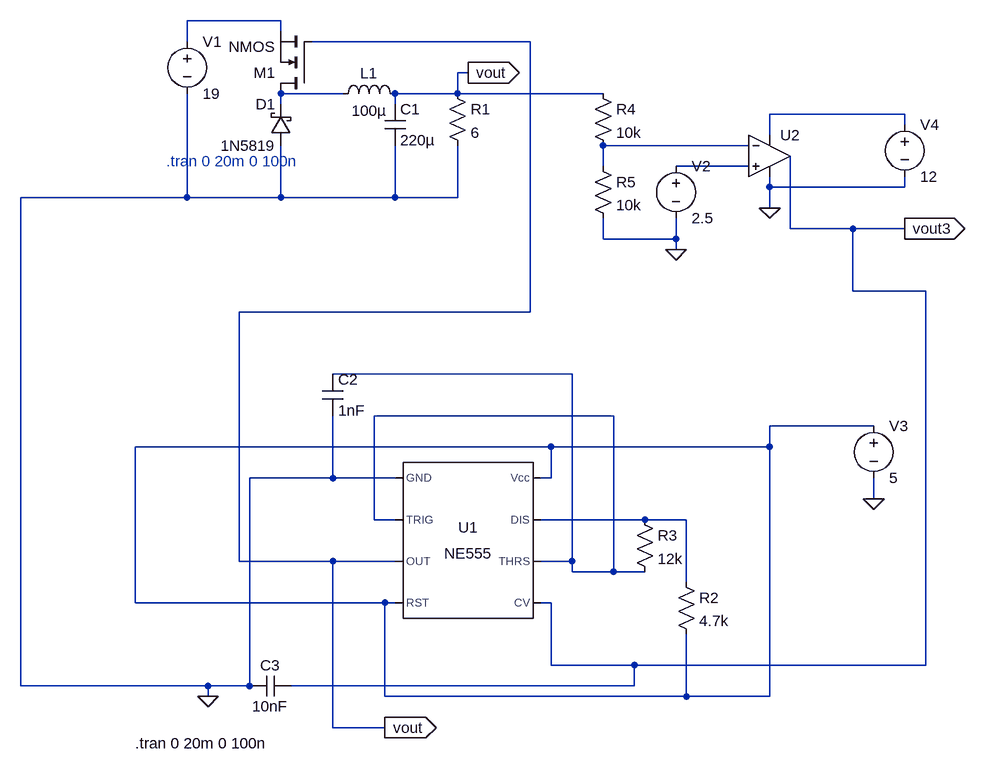
[diagram p0: schematic BUCKCONVERTER.asc]
BUCKCONVERTER.asc, the LTspice schematic file:
Version 4.1
SHEET 1 1076 1224
WIRE -16 64 -160 64
WIRE -16 80 -16 64
WIRE -160 96 -160 64
WIRE 368 96 32 96
WIRE 272 144 256 144
WIRE 80 176 -16 176
WIRE 256 176 256 144
WIRE 256 176 160 176
WIRE 480 176 256 176
WIRE -16 192 -16 176
WIRE 160 192 160 176
WIRE 944 208 736 208
WIRE 944 224 944 208
WIRE 736 240 736 208
WIRE 704 256 480 256
WIRE 480 288 480 256
WIRE 704 288 592 288
WIRE 736 320 736 304
WIRE 944 320 944 304
WIRE 944 320 736 320
WIRE -160 336 -160 176
WIRE -160 336 -416 336
WIRE -16 336 -16 256
WIRE -16 336 -160 336
WIRE 160 336 160 256
WIRE 160 336 -16 336
WIRE 256 336 256 256
WIRE 256 336 160 336
WIRE 736 352 736 320
WIRE 768 384 768 272
WIRE 864 384 768 384
WIRE 944 384 864 384
WIRE 480 400 480 368
WIRE 592 400 592 368
WIRE 592 400 480 400
WIRE 592 416 592 400
WIRE 864 480 864 384
WIRE 976 480 864 480
WIRE 368 512 368 96
WIRE 368 512 -80 512
WIRE 432 608 64 608
WIRE 496 672 128 672
WIRE 896 688 736 688
WIRE 400 720 -240 720
WIRE 736 720 736 688
WIRE 736 720 400 720
WIRE 64 768 64 672
WIRE 64 768 -64 768
WIRE 160 768 64 768
WIRE 400 768 400 720
WIRE 400 768 384 768
WIRE 896 800 896 768
WIRE 128 832 128 672
WIRE 160 832 128 832
WIRE 544 832 384 832
WIRE 608 832 544 832
WIRE -80 896 -80 512
WIRE 64 896 -80 896
WIRE 160 896 64 896
WIRE 432 896 432 608
WIRE 432 896 384 896
WIRE 432 912 432 896
WIRE 496 912 496 672
WIRE 496 912 432 912
WIRE 544 912 496 912
WIRE 608 928 608 832
WIRE -240 960 -240 720
WIRE 144 960 -240 960
WIRE 160 960 144 960
WIRE 400 960 384 960
WIRE 400 1056 400 960
WIRE 528 1056 400 1056
WIRE 976 1056 976 480
WIRE 976 1056 528 1056
WIRE -416 1088 -416 336
WIRE -128 1088 -416 1088
WIRE -64 1088 -64 768
WIRE -64 1088 -128 1088
WIRE 528 1088 528 1056
WIRE 528 1088 0 1088
WIRE -128 1104 -128 1088
WIRE 144 1104 144 960
WIRE 608 1104 608 1008
WIRE 608 1104 144 1104
WIRE 736 1104 736 720
WIRE 736 1104 608 1104
WIRE 64 1152 64 896
WIRE 144 1152 64 1152
FLAG 272 144 vout
IOPIN 272 144 Out
FLAG 144 1152 vout
IOPIN 144 1152 Out
FLAG -128 1104 0
FLAG 896 800 0
FLAG 736 352 0
FLAG 592 416 0
FLAG 944 384 vout3
IOPIN 944 384 Out
SYMBOL voltage -160 80 R0
WINDOW 123 0 0 Left 0
WINDOW 39 0 0 Left 0
SYMATTR InstName V1
SYMATTR Value 19
SYMBOL nmos 32 176 R180
SYMATTR InstName M1
SYMBOL ind 64 192 R270
WINDOW 0 32 56 VTop 2
WINDOW 3 5 56 VBottom 2
SYMATTR InstName L1
SYMATTR Value 100µ
SYMATTR SpiceLine Ipk=0.04 Rser=11 Rpar=2.11267e+06 Cpar=1.754p mfg="Würth Elektronik" pn="74476420 WE-GF 1210"
SYMBOL cap 144 192 R0
SYMATTR Value 220µ
SYMATTR InstName C1
SYMATTR SpiceLine V=2 Irms=3 Rser=0.015 Lser=0 mfg="Panasonic" pn="EEFUD0D221R" type="Al electrolytic"
SYMBOL res 240 160 R0
SYMATTR InstName R1
SYMATTR Value 6
SYMBOL schottky 0 256 R180
WINDOW 0 24 64 Left 2
WINDOW 3 24 0 Left 2
SYMATTR InstName D1
SYMATTR Value 1N5819
SYMBOL Misc\\NE555 272 864 R0
SYMATTR InstName U1
SYMBOL res 592 912 R0
SYMATTR InstName R2
SYMATTR Value 4.7k
SYMBOL res 528 816 R0
SYMATTR InstName R3
SYMATTR Value 12k
SYMBOL cap 48 608 R0
SYMATTR InstName C2
SYMATTR Value 1nF
SYMBOL voltage 896 672 R0
WINDOW 123 0 0 Left 0
WINDOW 39 0 0 Left 0
SYMATTR InstName V3
SYMATTR Value 5
SYMBOL res 464 160 R0
SYMATTR InstName R4
SYMATTR Value 10k
SYMBOL res 464 272 R0
SYMATTR InstName R5
SYMATTR Value 10k
SYMBOL OpAmps\\UniversalOpAmp2 736 272 R0
SYMATTR InstName U2
SYMBOL voltage 592 272 R0
WINDOW 123 0 0 Left 0
WINDOW 39 0 0 Left 0
SYMATTR InstName V2
SYMATTR Value 2.5
SYMBOL voltage 944 208 R0
WINDOW 123 0 0 Left 0
WINDOW 39 0 0 Left 0
SYMATTR InstName V4
SYMATTR Value 12
SYMBOL cap 0 1072 R90
WINDOW 0 0 32 VBottom 2
WINDOW 3 32 32 VTop 2
SYMATTR InstName C3
SYMATTR Value 10nF
TEXT -192 280 Left 2 ;.tran 0 20m 0 100n
TEXT -240 1176 Left 2 !.tran 0 20m 0 100n

The netlist it stands for:
* BUCKCONVERTER.asc
V1 N001 0 19
M1 N002 vout N001 N001 NMOS
L1 N002 vout 100µ Ipk=0.04 Rser=11 Rpar=2.11267e+06 Cpar=1.754p mfg="Würth Elektronik" pn="74476420 WE-GF 1210"
C1 vout 0 220µ V=2 Irms=3 Rser=0.015 Lser=0 mfg="Panasonic" pn="EEFUD0D221R" type="Al electrolytic"
R1 vout 0 6
D1 0 N002 1N5819
X§U1 0 N006 vout N007 vout3 N006 N008 N007 NE555  ; pins GND TRIG OUT RST CV THRS DIS Vcc
R2 N008 N007 4.7k
R3 N008 N006 12k
C2 N006 0 1nF
V3 N007 0 5
R4 vout N004 10k
R5 N004 0 10k
X§U2 N005 N004 N003 0 vout3 level2 Avol=1Meg GBW=10Meg Slew=10Meg Ilimit=25m Rail=0 Vos=0 En=0 Enk=0 In=0 Ink=0 Rin=500Meg  ; pins In+ In- V+ V- OUT
V2 N005 0 2.5
V4 N003 0 12
C3 vout3 0 10nF
.model D D
.lib standard.dio
.model NMOS NMOS
.model PMOS PMOS
.lib standard.mos
* .tran 0 20m 0 100n
.tran 0 20m 0 100n
.lib NE555.sub
.lib UniversalOpAmp2.lib
.backanno
.end